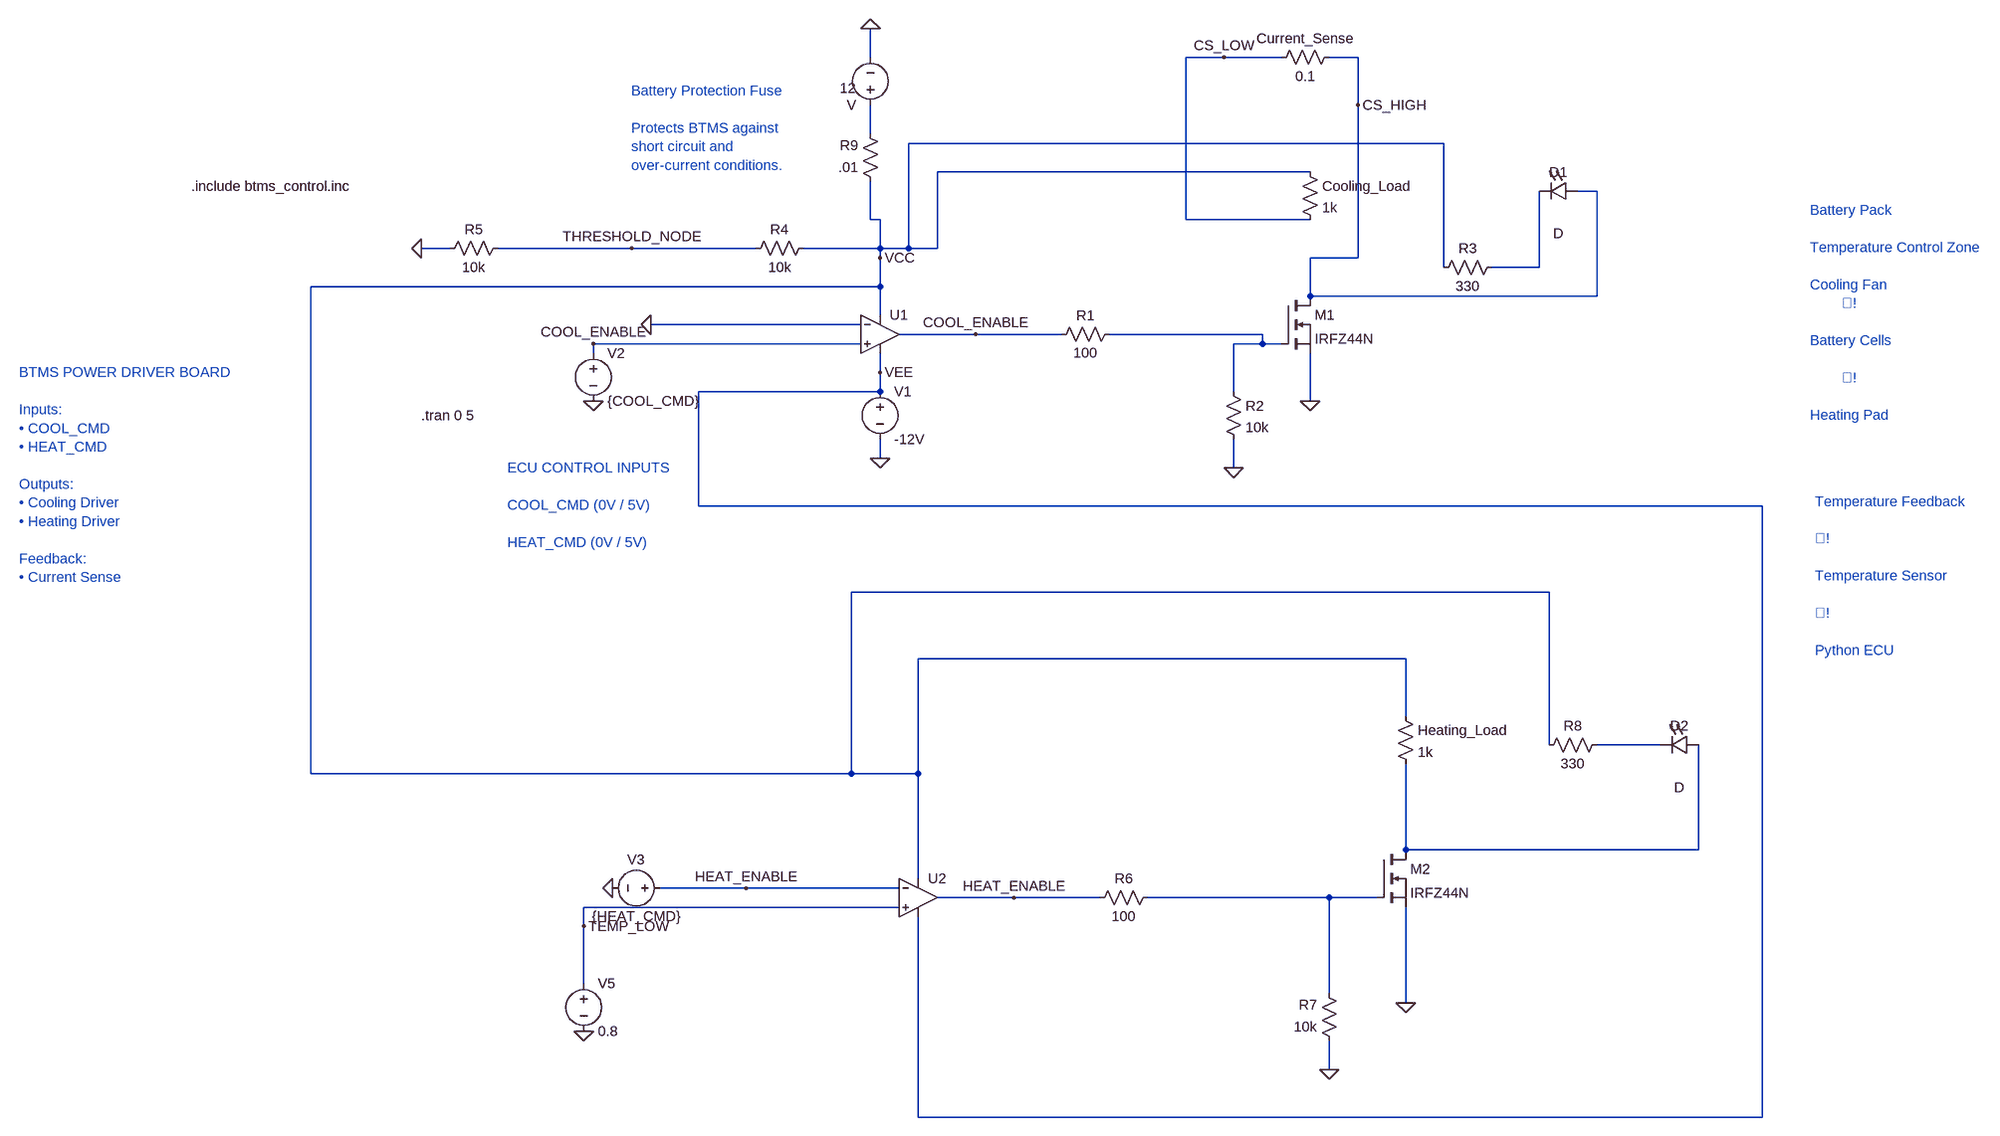
[diagram p0: schematic BTMS_Controller.asc]
BTMS_Controller.asc, the LTspice schematic file:
Version 4.1
SHEET 1 2644 1668
WIRE 496 -112 496 -160
WIRE 1088 -112 1024 -112
WIRE 1184 -112 1088 -112
WIRE 1312 -112 1264 -112
WIRE 1312 -32 1312 -112
WIRE 496 16 496 -32
WIRE 1456 32 560 32
WIRE 1232 80 608 80
WIRE 1712 112 1680 112
WIRE 496 160 496 96
WIRE 512 160 496 160
WIRE 1024 160 1024 -112
WIRE 1232 160 1024 160
WIRE -208 208 -256 208
WIRE 96 208 -128 208
WIRE 304 208 96 208
WIRE 512 208 512 160
WIRE 512 208 384 208
WIRE 560 208 560 32
WIRE 560 208 512 208
WIRE 608 208 608 80
WIRE 608 208 560 208
WIRE 512 224 512 208
WIRE 1312 224 1312 -32
WIRE 1312 224 1232 224
WIRE 1456 240 1456 32
WIRE 1616 240 1616 112
WIRE 1616 240 1536 240
WIRE 512 272 512 224
WIRE 512 272 -448 272
WIRE 1232 288 1232 224
WIRE 1712 288 1712 112
WIRE 1712 288 1232 288
WIRE 512 320 512 272
WIRE 480 336 128 336
WIRE 672 352 544 352
WIRE 816 352 672 352
WIRE 1152 352 896 352
WIRE 480 368 32 368
WIRE 1152 368 1152 352
WIRE 1152 368 1104 368
WIRE 1184 368 1152 368
WIRE 32 384 32 368
WIRE 512 416 512 384
WIRE 512 448 512 416
WIRE 512 448 208 448
WIRE 1104 448 1104 368
WIRE 1232 464 1232 384
WIRE 512 560 512 528
WIRE 1104 576 1104 528
WIRE 208 640 208 448
WIRE 2256 640 208 640
WIRE 1632 784 464 784
WIRE 1392 896 576 896
WIRE 1392 992 1392 896
WIRE 1632 1040 1632 784
WIRE 1968 1040 1712 1040
WIRE -448 1088 -448 272
WIRE 464 1088 464 784
WIRE 464 1088 -448 1088
WIRE 576 1088 576 896
WIRE 576 1088 464 1088
WIRE 1392 1216 1392 1072
WIRE 2032 1216 2032 1040
WIRE 2032 1216 1392 1216
WIRE 576 1264 576 1088
WIRE 288 1280 144 1280
WIRE 544 1280 288 1280
WIRE 736 1296 608 1296
WIRE 880 1296 736 1296
WIRE 1264 1296 960 1296
WIRE 1344 1296 1264 1296
WIRE 544 1312 16 1312
WIRE 16 1344 16 1312
WIRE 16 1440 16 1344
WIRE 1264 1456 1264 1296
WIRE 1392 1472 1392 1312
WIRE 1264 1584 1264 1536
WIRE 576 1664 576 1328
WIRE 2256 1664 2256 640
WIRE 2256 1664 576 1664
FLAG 496 -160 0
FLAG 512 560 0
FLAG 32 464 0
FLAG 512 224 VCC
FLAG 512 416 VEE
FLAG 32 368 COOL_ENABLE
FLAG 1104 576 0
FLAG 1232 464 0
FLAG -256 208 0
FLAG 96 208 THRESHOLD_NODE
FLAG 1392 1472 0
FLAG 1264 1584 0
FLAG 128 336 0
FLAG 672 352 COOL_ENABLE
FLAG 16 1344 TEMP_LOW
FLAG 736 1296 HEAT_ENABLE
FLAG 16 1520 0
FLAG 288 1280 HEAT_ENABLE
FLAG 64 1280 0
FLAG 1088 -112 CS_LOW
FLAG 1312 -32 CS_HIGH
SYMBOL voltage 496 -16 R180
WINDOW 3 24 44 Left 2
WINDOW 123 0 0 Left 0
WINDOW 39 0 0 Left 0
SYMATTR Value 12
SYMATTR InstName V
SYMBOL voltage 32 368 R0
WINDOW 123 0 0 Left 0
WINDOW 39 0 0 Left 0
SYMATTR InstName V2
SYMATTR Value {COOL_CMD}
SYMBOL OpAmps\\UniversalOpAmp2 512 352 R0
SYMATTR InstName U1
SYMBOL voltage 512 432 R0
WINDOW 123 0 0 Left 0
WINDOW 39 0 0 Left 0
SYMATTR InstName V1
SYMATTR Value -12V
SYMBOL nmos 1184 288 R0
SYMATTR InstName M1
SYMATTR Value IRFZ44N
SYMBOL res 912 336 R90
WINDOW 0 0 56 VBottom 2
WINDOW 3 32 56 VTop 2
SYMATTR InstName R1
SYMATTR Value 100
SYMBOL res 1088 432 R0
SYMATTR InstName R2
SYMATTR Value 10k
SYMBOL res 1216 64 R0
SYMATTR InstName Cooling_Load
SYMATTR Value 1k
SYMBOL res 1552 224 R90
WINDOW 0 0 56 VBottom 2
WINDOW 3 32 56 VTop 2
SYMATTR InstName R3
SYMATTR Value 330
SYMBOL LED 1680 96 R90
WINDOW 0 0 32 VBottom 2
WINDOW 3 72 32 VTop 2
SYMATTR InstName D1
SYMBOL res 400 192 R90
WINDOW 0 0 56 VBottom 2
WINDOW 3 32 56 VTop 2
SYMATTR InstName R4
SYMATTR Value 10k
SYMBOL res -112 192 R90
WINDOW 0 0 56 VBottom 2
WINDOW 3 32 56 VTop 2
SYMATTR InstName R5
SYMATTR Value 10k
SYMBOL OpAmps\\UniversalOpAmp2 576 1296 R0
SYMATTR InstName U2
SYMBOL res 976 1280 R90
WINDOW 0 0 56 VBottom 2
WINDOW 3 32 56 VTop 2
SYMATTR InstName R6
SYMATTR Value 100
SYMBOL res 1280 1552 R180
WINDOW 0 36 76 Left 2
WINDOW 3 36 40 Left 2
SYMATTR InstName R7
SYMATTR Value 10k
SYMBOL res 1616 1056 R270
WINDOW 0 32 56 VTop 2
WINDOW 3 0 56 VBottom 2
SYMATTR InstName R8
SYMATTR Value 330
SYMBOL nmos 1344 1216 R0
SYMATTR InstName M2
SYMATTR Value IRFZ44N
SYMBOL LED 2032 1024 R90
WINDOW 0 0 32 VBottom 2
WINDOW 3 72 32 VTop 2
SYMATTR InstName D2
SYMBOL res 1376 976 R0
SYMATTR InstName Heating_Load
SYMATTR Value 1k
SYMBOL voltage 16 1424 R0
WINDOW 123 0 0 Left 0
WINDOW 39 0 0 Left 0
SYMATTR InstName V5
SYMATTR Value 0.8
SYMBOL voltage 160 1280 R90
WINDOW 0 -32 56 VBottom 2
WINDOW 3 32 56 VTop 2
WINDOW 123 0 0 Left 0
WINDOW 39 0 0 Left 0
SYMATTR InstName V3
SYMATTR Value {HEAT_CMD}
SYMBOL res 1280 -128 R90
WINDOW 0 0 56 VBottom 2
WINDOW 3 32 56 VTop 2
SYMATTR InstName Current_Sense
SYMATTR Value 0.1
SYMBOL res 512 112 R180
WINDOW 0 36 76 Left 2
WINDOW 3 36 40 Left 2
SYMATTR InstName R9
SYMATTR Value .01
TEXT -256 488 Left 2 !.tran 0 5
TEXT 2336 144 Left 2 ;Battery Pack\n \nTemperature Control Zone\n \nCooling Fan\n        !\n \nBattery Cells\n \n        !\n \nHeating Pad
TEXT 2344 632 Left 2 ;Temperature Feedback\n \n!\n \nTemperature Sensor\n \n!\n \nPython ECU
TEXT -648 104 Left 2 !.include btms_control.inc
TEXT 96 -56 Left 2 ;Battery Protection Fuse\n \nProtects BTMS against\nshort circuit and\nover-current conditions.
TEXT -112 576 Left 2 ;ECU CONTROL INPUTS\n \nCOOL_CMD (0V / 5V)\n \nHEAT_CMD (0V / 5V)
TEXT -936 416 Left 2 ;BTMS POWER DRIVER BOARD\n \nInputs:\n• COOL_CMD\n• HEAT_CMD\n \nOutputs:\n• Cooling Driver\n• Heating Driver\n \nFeedback:\n• Current Sense

The netlist it stands for:
* BTMS_Controller.asc
V N001 0 12
V2 COOL_ENABLE 0 {COOL_CMD}
X§U1 COOL_ENABLE 0 VCC VEE COOL_ENABLE level2 Avol=1Meg GBW=10Meg Slew=10Meg Ilimit=25m Rail=0 Vos=0 En=0 Enk=0 In=0 Ink=0 Rin=500Meg  ; pins In+ In- V+ V- OUT
V1 VEE 0 -12V
M1 CS_HIGH N003 0 0 IRFZ44N
R1 N003 COOL_ENABLE 100
R2 N003 0 10k
R§Cooling_Load VCC CS_LOW 1k
R3 N002 VCC 330
D1 CS_HIGH N002 D
R4 VCC THRESHOLD_NODE 10k
R5 THRESHOLD_NODE 0 10k
X§U2 TEMP_LOW HEAT_ENABLE VCC VEE HEAT_ENABLE level2 Avol=1Meg GBW=10Meg Slew=10Meg Ilimit=25m Rail=0 Vos=0 En=0 Enk=0 In=0 Ink=0 Rin=500Meg  ; pins In+ In- V+ V- OUT
R6 N006 HEAT_ENABLE 100
R7 0 N006 10k
R8 VCC N004 330
M2 N005 N006 0 0 IRFZ44N
D2 N005 N004 D
R§Heating_Load VCC N005 1k
V5 TEMP_LOW 0 0.8
V3 HEAT_ENABLE 0 {HEAT_CMD}
R§Current_Sense CS_HIGH CS_LOW 0.1
R9 VCC N001 .01
.model D D
.lib standard.dio
.model NMOS NMOS
.model PMOS PMOS
.lib standard.mos
.tran 0 5
* Battery Pack
* Temperature Control Zone
* Cooling Fan
*         !
* Battery Cells
*         !
* Heating Pad
* Temperature Feedback
* !
* Temperature Sensor
* !
* Python ECU
.include btms_control.inc
* Battery Protection Fuse
* Protects BTMS against
* short circuit and
* over-current conditions.
* ECU CONTROL INPUTS
* COOL_CMD (0V / 5V)
* HEAT_CMD (0V / 5V)
* BTMS POWER DRIVER BOARD
* Inputs:
* • COOL_CMD
* • HEAT_CMD
* Outputs:
* • Cooling Driver
* • Heating Driver
* Feedback:
* • Current Sense
.lib UniversalOpAmp2.lib
.backanno
.end